# Altium schematic sheet AIP74LVC8T245TA24.TR.schdoc
size 127 x 101 mm
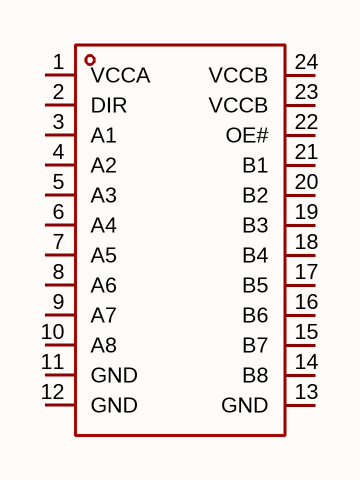
[diagram p0: AIP74LVC8T245TA24.TR.schdoc]

## Parts
U?  aip74lvc8t245ta24.tr  [TSSOP-24_L7.8-W4.4-P0.65-LS6.4-BL]  (value not drawn)

## Nets

Not connected (* = marked no-connect by the designer): U? 1(VCCA) 2(DIR) 3(A1) 4(A2) 5(A3) 6(A4) 7(A5) 8(A6) 9(A7) 10(A8) 11(GND) 12(GND) 13(GND) 14(B8) 15(B7) 16(B6) 17(B5) 18(B4) 19(B3) 20(B2) 21(B1) 22(OE#) 23(VCCB) 24(VCCB)

## Library data of the parts
U? = aip74lvc8t245ta24.tr: 输入类型:-;工作电压:1.2V~5.5V;元件数:1；1;每个元件位数:8;灌电流(IOL):32mA;拉电流(IOH):32mA;; Manufacturer: I-CORE(中微爱芯); AddInBom: yes; ModelId: 57e278220af748a2882c4abba4094eb9; ModelName: TSSOP-24_L7.8-W4.4-H1.0-LS6.4-P0.65; ModelTransform: 252.188,307.086,0,90,0,0,0,0,0; output type: 三态; Number of Elements: 1；1; Number of Bits per Element: 8; Channel Type: 双向; Current - Output Low(IOL): 32mA; Logic Family: 74LVC; Quiescent Current: 25uA; Propagation Delay: 5.4ns@5V,50pF; Symbol: AIP74LVC8T245TA24.TR; LCSC Part Name: 双电源带三态控制的8路总线收发器 1.2~5.5V; SupplierPart: C4945079; ManufacturerPart: AiP74LVC8T245TA24.TR; Supplier Footprint: TSSOP-24; JLCPCB Part Class: Extended Part; Datasheet: https://item.szlcsc.com/datasheet/AiP74LVC8T245TA24.TR/5519627.html; Supplier: LCSC; ConvertToPcb: yes; FootprintName: TSSOP-24_L7.8-W4.4-P0.65-LS6.4-BL; Input type: -; Voltage - Supply: 1.2V~5.5V; Current - Output High(IOH): 32mA; Operating Temperature: -40℃~+105℃; Features: 掉电隔离；输出使能；总线保持；电平转换